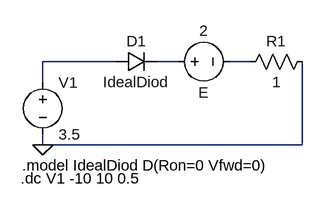
[diagram p0: schematic DC_chara.asc]
DC_chara.asc, the LTspice schematic file:
Version 4
SHEET 1 880 680
WIRE 112 96 0 96
WIRE 208 96 176 96
WIRE 320 96 288 96
WIRE 0 128 0 96
WIRE 0 224 0 208
WIRE 400 224 400 96
WIRE 400 224 0 224
FLAG 0 224 0
SYMBOL voltage 192 96 R270
WINDOW 0 -32 56 VBottom 2
WINDOW 3 32 56 VTop 2
WINDOW 123 0 0 Left 0
WINDOW 39 0 0 Left 0
SYMATTR InstName E
SYMATTR Value 2
SYMBOL res 416 80 R90
WINDOW 0 0 56 VBottom 2
WINDOW 3 32 56 VTop 2
SYMATTR InstName R1
SYMATTR Value 1
SYMBOL diode 112 112 R270
WINDOW 0 32 32 VTop 2
WINDOW 3 0 32 VBottom 2
SYMATTR InstName D1
SYMATTR Value IdealDiod
SYMBOL voltage 0 112 R0
WINDOW 123 0 0 Left 0
WINDOW 39 0 0 Left 0
SYMATTR InstName V1
SYMATTR Value 3.5
TEXT -32 256 Left 2 !.model IdealDiod D(Ron=0 Vfwd=0)
TEXT -34 276 Left 2 !.dc V1 -10 10 0.5

The netlist it stands for:
* DC_chara.asc
V§E N002 N003 2
R1 0 N003 1
D1 N001 N002 IdealDiod
V1 N001 0 3.5
.model D D
.lib standard.dio
.model IdealDiod D(Ron=0 Vfwd=0)
.dc V1 -10 10 0.5
.backanno
.end